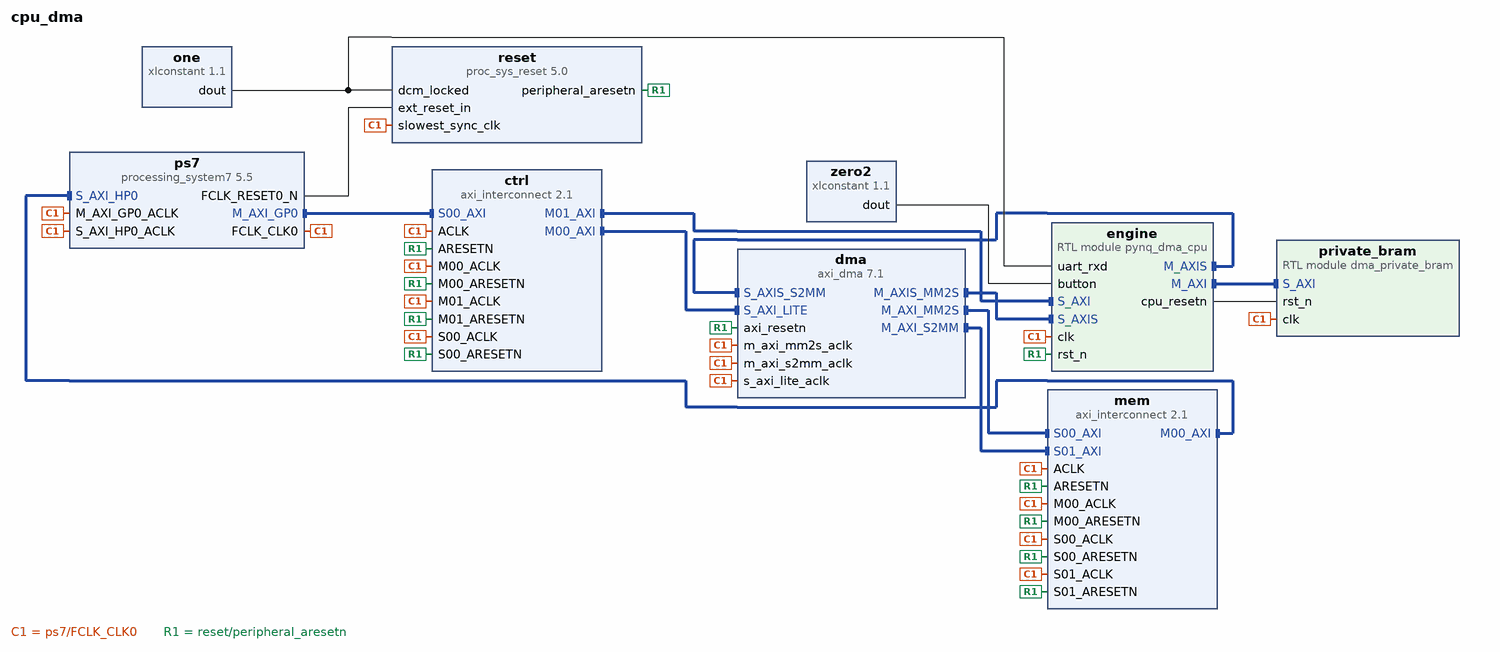
[diagram p0: block diagram of the top level]
# Vivado block design cpu_dma, xc7z020clg400-1, Vivado 2025.2
create_bd_design cpu_dma

create_bd_cell -type ip -vlnv xilinx.com:ip:processing_system7:5.5 ps7
set_property -dict {CONFIG.PCW_FPGA0_PERIPHERAL_FREQMHZ 100 CONFIG.PCW_USE_S_AXI_HP0 1} [get_bd_cells ps7]
# 34 more settings of ps7 are not shown: defaults, MIO pin electricals, DDR timing, and values the tool derives
create_bd_cell -type ip -vlnv xilinx.com:ip:axi_dma:7.1 dma
set_property -dict [list \
  CONFIG.c_include_mm2s 1 \
  CONFIG.c_include_mm2s_dre 0 \
  CONFIG.c_include_s2mm 1 \
  CONFIG.c_include_s2mm_dre 0 \
  CONFIG.c_include_sg 0 \
  CONFIG.c_m_axi_mm2s_data_width 32 \
  CONFIG.c_m_axi_s2mm_data_width 32 \
  CONFIG.c_m_axis_mm2s_tdata_width 32 \
  CONFIG.c_s_axis_s2mm_tdata_width 32 \
  CONFIG.c_sg_length_width 14 \
] [get_bd_cells dma]
create_bd_cell -type ip -vlnv xilinx.com:ip:axi_interconnect:2.1 ctrl
set_property -dict {CONFIG.NUM_MI 2} [get_bd_cells ctrl]
create_bd_cell -type ip -vlnv xilinx.com:ip:axi_interconnect:2.1 mem
set_property -dict {CONFIG.NUM_MI 1 CONFIG.NUM_SI 2 CONFIG.XBAR_DATA_WIDTH 64} [get_bd_cells mem]
create_bd_cell -type ip -vlnv xilinx.com:ip:proc_sys_reset:5.0 reset
create_bd_cell -type ip -vlnv xilinx.com:ip:xlconstant:1.1 one
set_property -dict {CONFIG.CONST_VAL 1} [get_bd_cells one]
create_bd_cell -type ip -vlnv xilinx.com:ip:xlconstant:1.1 zero2
set_property -dict {CONFIG.CONST_VAL 0 CONFIG.CONST_WIDTH 2} [get_bd_cells zero2]
create_bd_cell -type module -reference pynq_dma_cpu engine
create_bd_cell -type module -reference dma_private_bram private_bram

# ---- connections ----

connect_bd_intf_net [get_bd_intf_pins ctrl/M00_AXI] [get_bd_intf_pins dma/S_AXI_LITE]
connect_bd_intf_net [get_bd_intf_pins ctrl/M01_AXI] [get_bd_intf_pins engine/S_AXI]
connect_bd_intf_net [get_bd_intf_pins dma/M_AXIS_MM2S] [get_bd_intf_pins engine/S_AXIS]
connect_bd_intf_net [get_bd_intf_pins dma/M_AXI_MM2S] [get_bd_intf_pins mem/S00_AXI]
connect_bd_intf_net [get_bd_intf_pins dma/M_AXI_S2MM] [get_bd_intf_pins mem/S01_AXI]
connect_bd_intf_net [get_bd_intf_pins engine/M_AXI] [get_bd_intf_pins private_bram/S_AXI]
connect_bd_intf_net [get_bd_intf_pins engine/M_AXIS] [get_bd_intf_pins dma/S_AXIS_S2MM]
connect_bd_intf_net [get_bd_intf_pins mem/M00_AXI] [get_bd_intf_pins ps7/S_AXI_HP0]
connect_bd_intf_net [get_bd_intf_pins ps7/M_AXI_GP0] [get_bd_intf_pins ctrl/S00_AXI]
connect_bd_net [get_bd_pins engine/cpu_resetn] [get_bd_pins private_bram/rst_n]
connect_bd_net [get_bd_pins one/dout] [get_bd_pins reset/dcm_locked] [get_bd_pins engine/uart_rxd]
connect_bd_net [get_bd_pins ps7/FCLK_CLK0] \
  [get_bd_pins ps7/M_AXI_GP0_ACLK] [get_bd_pins ps7/S_AXI_HP0_ACLK] [get_bd_pins ctrl/ACLK] [get_bd_pins ctrl/S00_ACLK] \
  [get_bd_pins ctrl/M00_ACLK] [get_bd_pins ctrl/M01_ACLK] [get_bd_pins mem/ACLK] [get_bd_pins mem/S00_ACLK] \
  [get_bd_pins mem/S01_ACLK] [get_bd_pins mem/M00_ACLK] [get_bd_pins dma/s_axi_lite_aclk] [get_bd_pins dma/m_axi_mm2s_aclk] \
  [get_bd_pins dma/m_axi_s2mm_aclk] [get_bd_pins reset/slowest_sync_clk] [get_bd_pins engine/clk] \
  [get_bd_pins private_bram/clk]
connect_bd_net [get_bd_pins ps7/FCLK_RESET0_N] [get_bd_pins reset/ext_reset_in]
connect_bd_net [get_bd_pins reset/peripheral_aresetn] \
  [get_bd_pins ctrl/ARESETN] [get_bd_pins ctrl/S00_ARESETN] [get_bd_pins ctrl/M00_ARESETN] [get_bd_pins ctrl/M01_ARESETN] \
  [get_bd_pins mem/ARESETN] [get_bd_pins mem/S00_ARESETN] [get_bd_pins mem/S01_ARESETN] [get_bd_pins mem/M00_ARESETN] \
  [get_bd_pins dma/axi_resetn] [get_bd_pins engine/rst_n]
connect_bd_net [get_bd_pins zero2/dout] [get_bd_pins engine/button]

# ---- address map ----
assign_bd_address -offset 0x00000000 -range 512M -target_address_space [get_bd_addr_spaces dma/Data_MM2S] [get_bd_addr_segs ps7/S_AXI_HP0/HP0_DDR_LOWOCM]
assign_bd_address -offset 0x00000000 -range 512M -target_address_space [get_bd_addr_spaces dma/Data_S2MM] [get_bd_addr_segs ps7/S_AXI_HP0/HP0_DDR_LOWOCM]
assign_bd_address -offset 0x10000000 -range 128K -target_address_space [get_bd_addr_spaces engine/M_AXI] [get_bd_addr_segs private_bram/S_AXI/reg0]
assign_bd_address -offset 0x40000000 -range 4K -target_address_space [get_bd_addr_spaces ps7/Data] [get_bd_addr_segs engine/S_AXI/reg0]
assign_bd_address -offset 0x40400000 -range 64K -target_address_space [get_bd_addr_spaces ps7/Data] [get_bd_addr_segs dma/S_AXI_LITE/Reg]

validate_bd_design
save_bd_design
